# Altium project Merge-Octo-Electrode.PrjPcb
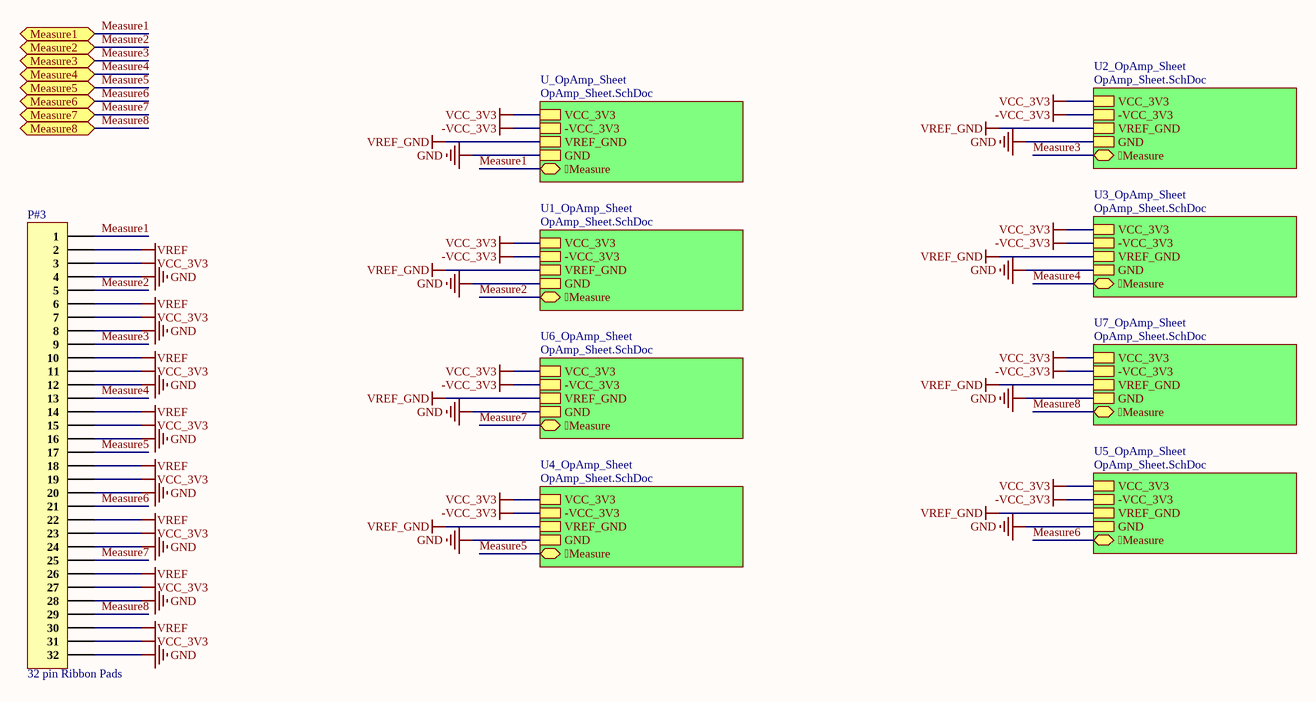
[diagram p0: Main_Sheet.SchDoc]
2 sheets, 265 parts. Net scope: hierarchical (ports join the sheet entries above them; power ports are global).
Board file: Octo-Electrode.PcbDoc
Sheets:
  Main_Sheet.SchDoc
    U_OpAmp_Sheet = OpAmp_Sheet.SchDoc
    U1_OpAmp_Sheet = OpAmp_Sheet.SchDoc
    U2_OpAmp_Sheet = OpAmp_Sheet.SchDoc
    U3_OpAmp_Sheet = OpAmp_Sheet.SchDoc
    U4_OpAmp_Sheet = OpAmp_Sheet.SchDoc
    U5_OpAmp_Sheet = OpAmp_Sheet.SchDoc
    U6_OpAmp_Sheet = OpAmp_Sheet.SchDoc
    U7_OpAmp_Sheet = OpAmp_Sheet.SchDoc

## Sheet Main_Sheet.SchDoc: =Projectname
size A4; SheetNumber: 1; SheetTotal: 2

### Parts
P#3  32 pin Ribbon Pads  [32 pin Ribbon Pads.]

### Sub-sheets
U1_OpAmp_Sheet = OpAmp_Sheet.SchDoc: VCC_3V3, -VCC_3V3, VREF_GND, GND, Measure (bidir)
U2_OpAmp_Sheet = OpAmp_Sheet.SchDoc: VCC_3V3, -VCC_3V3, VREF_GND, GND, Measure (bidir)
U3_OpAmp_Sheet = OpAmp_Sheet.SchDoc: VCC_3V3, -VCC_3V3, VREF_GND, GND, Measure (bidir)
U4_OpAmp_Sheet = OpAmp_Sheet.SchDoc: VCC_3V3, -VCC_3V3, VREF_GND, GND, Measure (bidir)
U5_OpAmp_Sheet = OpAmp_Sheet.SchDoc: VCC_3V3, -VCC_3V3, VREF_GND, GND, Measure (bidir)
U6_OpAmp_Sheet = OpAmp_Sheet.SchDoc: VCC_3V3, -VCC_3V3, VREF_GND, GND, Measure (bidir)
U7_OpAmp_Sheet = OpAmp_Sheet.SchDoc: VCC_3V3, -VCC_3V3, VREF_GND, GND, Measure (bidir)
U_OpAmp_Sheet = OpAmp_Sheet.SchDoc: VCC_3V3, -VCC_3V3, VREF_GND, GND, Measure (bidir)

### Ports
Measure1 (bidir), Measure2 (bidir), Measure3 (bidir), Measure4 (bidir), Measure5 (bidir), Measure6 (bidir), Measure7 (bidir), Measure8 (bidir)

### Nets
-VCC_3V3: sheet U_OpAmp_Sheet/-VCC_3V3, sheet U1_OpAmp_Sheet/-VCC_3V3, sheet U2_OpAmp_Sheet/-VCC_3V3, sheet U3_OpAmp_Sheet/-VCC_3V3, sheet U4_OpAmp_Sheet/-VCC_3V3, sheet U5_OpAmp_Sheet/-VCC_3V3, sheet U6_OpAmp_Sheet/-VCC_3V3, sheet U7_OpAmp_Sheet/-VCC_3V3
GND: P#3.4 P#3.8 P#3.12 P#3.16 P#3.20 P#3.24 P#3.28 P#3.32 ; sheet U_OpAmp_Sheet/GND, sheet U1_OpAmp_Sheet/GND, sheet U2_OpAmp_Sheet/GND, sheet U3_OpAmp_Sheet/GND, sheet U4_OpAmp_Sheet/GND, sheet U5_OpAmp_Sheet/GND, sheet U6_OpAmp_Sheet/GND, sheet U7_OpAmp_Sheet/GND
VCC_3V3: P#3.3 P#3.7 P#3.11 P#3.15 P#3.19 P#3.23 P#3.27 P#3.31 ; sheet U_OpAmp_Sheet/VCC_3V3, sheet U1_OpAmp_Sheet/VCC_3V3, sheet U2_OpAmp_Sheet/VCC_3V3, sheet U3_OpAmp_Sheet/VCC_3V3, sheet U4_OpAmp_Sheet/VCC_3V3, sheet U5_OpAmp_Sheet/VCC_3V3, sheet U6_OpAmp_Sheet/VCC_3V3, sheet U7_OpAmp_Sheet/VCC_3V3
VREF: P#3.2 P#3.6 P#3.10 P#3.14 P#3.18 P#3.22 P#3.26 P#3.30
VREF_GND: sheet U_OpAmp_Sheet/VREF_GND, sheet U1_OpAmp_Sheet/VREF_GND, sheet U2_OpAmp_Sheet/VREF_GND, sheet U3_OpAmp_Sheet/VREF_GND, sheet U4_OpAmp_Sheet/VREF_GND, sheet U5_OpAmp_Sheet/VREF_GND, sheet U6_OpAmp_Sheet/VREF_GND, sheet U7_OpAmp_Sheet/VREF_GND
Measure1: P#3.1 ; port Measure1, sheet U_OpAmp_Sheet/Measure  [project net Measure]
Measure2: P#3.5 ; port Measure2, sheet U1_OpAmp_Sheet/Measure  [project net Measure]
Measure3: P#3.9 ; port Measure3, sheet U2_OpAmp_Sheet/Measure  [project net Measure]
Measure4: P#3.13 ; port Measure4, sheet U3_OpAmp_Sheet/Measure  [project net Measure]
Measure5: P#3.17 ; port Measure5, sheet U4_OpAmp_Sheet/Measure  [project net Measure]
Measure6: P#3.21 ; port Measure6, sheet U5_OpAmp_Sheet/Measure  [project net Measure]
Measure7: P#3.25 ; port Measure7, sheet U6_OpAmp_Sheet/Measure  [project net Measure]
Measure8: P#3.29 ; port Measure8, sheet U7_OpAmp_Sheet/Measure  [project net Measure]

### Notes on the sheet
- File:
- Title:
- Date:
- Page
- Num:
- Total:
- Drawn By: Huzaifa Ali

### Library data of the parts
P#3 = 32 pin Ribbon Pads: Ribbon wire Connection Pads

## Sheet OpAmp_Sheet.SchDoc: =Projectname
size A4; DocumentNumber: 1; SheetNumber: 2; SheetTotal: 2
Used 8 times, as channels U_OpAmp_Sheet, U1_OpAmp_Sheet, U2_OpAmp_Sheet, U3_OpAmp_Sheet, U4_OpAmp_Sheet, U5_OpAmp_Sheet, U6_OpAmp_Sheet, U7_OpAmp_Sheet. Parts and nets are listed once, with the designators drawn on the sheet.
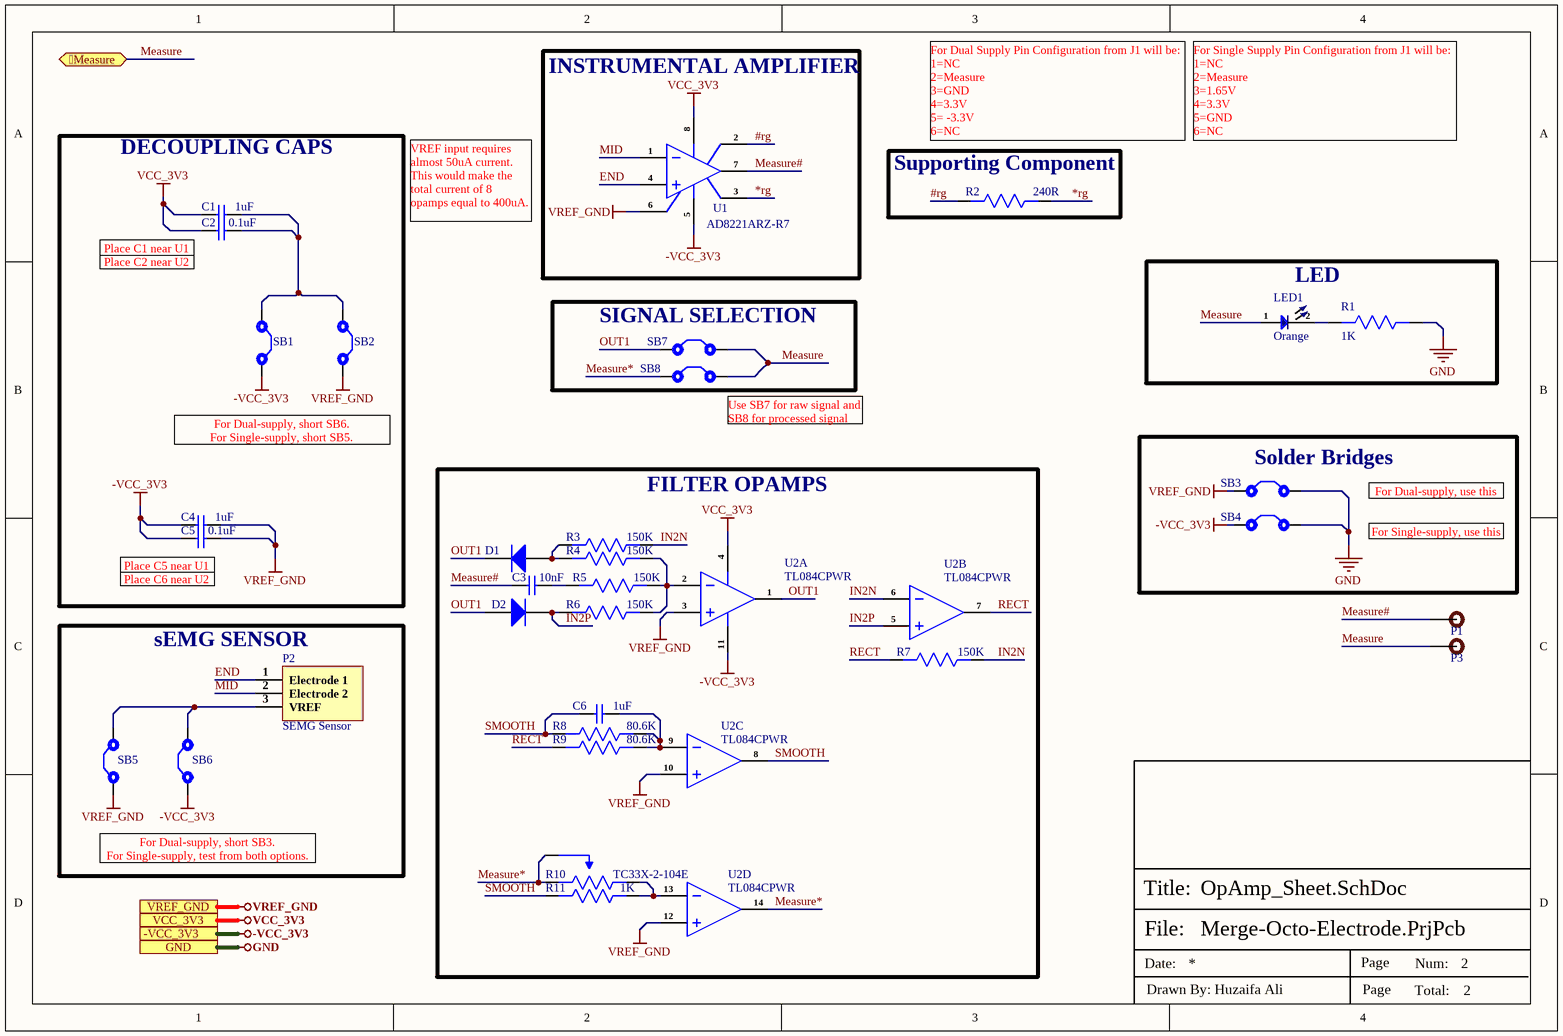
[diagram p1: OpAmp_Sheet.SchDoc]

### Parts
C1  1uF  [Cap-0402]
C2  0.1uF  [Cap-0402]
C3  10nF  [Cap-0402]
C4  1uF  [Cap-0402]
C5  0.1uF  [Cap-0402]
C6  1uF  [Cap-0402]
D1  1N4148WS-7-F  [SOD-323]  (value not drawn)
D2  1N4148WS-7-F  [SOD-323]  (value not drawn)
LED1  Orange  [LED-0603]
P1  Test Point  [Test-point]  (value not drawn)
P2  SEMG Sensor  [sEMG-sensor]
P3  Test Point  [Test-point]  (value not drawn)
R1  1K  [Res-0402]
R2  240R  [Res-0402]
R3  150K  [Res-0402]
R4  150K  [Res-0402]
R5  150K  [Res-0402]
R6  150K  [Res-0402]
R7  150K  [Res-0402]
R8  80.6K  [Res-0402]
R9  80.6K  [Res-0402]
R10  TC33X-2-104E  [TC33X-2-104E_]
R11  1K  [Res-0402]
SB1  Solder Bridge 0402  [Solder Bridge 0402]  (value not drawn)
SB2  Solder Bridge 0402  [Solder Bridge 0402]  (value not drawn)
SB3  Solder Bridge 0402  [Solder Bridge 0402]  (value not drawn)
SB4  Solder Bridge 0402  [Solder Bridge 0402]  (value not drawn)
SB5  Solder Bridge 0402  [Solder Bridge 0402]  (value not drawn)
SB6  Solder Bridge 0402  [Solder Bridge 0402]  (value not drawn)
SB7  Solder Bridge 0402  [Solder Bridge 0402]  (value not drawn)
SB8  Solder Bridge 0402  [Solder Bridge 0402]  (value not drawn)
U1  AD8221ARZ-R7  [SOIC-8]
U2  TL084CPWR  [14-TSSOP]  (parts A,B,C,D of 4)

### Blocks framed on the sheet
INSTRUMENTAL AMPLIFIER: U1
DECOUPLING CAPS: C1 C2 C4 C5 SB1 SB2
Supporting Component: R2
SIGNAL SELECTION: SB7 SB8
LED: LED1 R1
Solder Bridges: SB3 SB4
FILTER OPAMPS: C3 C6 D1 D2 R3-R11 U2
sEMG SENSOR: P2 SB5 SB6

### Ports
Measure (bidir), -VCC_3V3, GND, VCC_3V3, VREF_GND

### Nets
-VCC_3V3: C4.1 C5.1 SB1.2 SB4.1 SB6.2 U1.5(V-) U2.11(VCC-) ; port -VCC_3V3
GND: R1.1 SB3.2 SB4.2 ; port GND
VCC_3V3: C1.1 C2.1 U1.8(V+) U2.4(VCC+) ; port VCC_3V3
VREF_GND: C4.2 C5.2 SB2.2 SB3.1 SB5.2 U1.6(REF) U2.3(IN+) U2.10(3IN+) U2.12(4IN+) ; port VREF_GND
#rg: R2.2 U1.2(RG)
*rg: R2.1 U1.3(RG)
END: P2.1(Electrode_1) U1.4(IN+)
IN2N: R3.1 R7.1 U2.6(2IN-)
IN2P: D2.1(K) R6.2 U2.5(2IN+)
Measure: LED1.1 P3.1 SB7.2 SB8.2 ; port Measure
Measure#: C3.1 P1.1 U1.7(VOUT)
Measure*: R10.1(CCW) R10.2(Wiper) SB8.1 U2.14(4OUT)
MID: P2.2(Electrode_2) U1.1(IN-)
OUT1: D1.1(K) D2.2(A) SB7.1 U2.1(1OUT)
RECT: R7.2 R9.2 U2.7(2OUT)
SMOOTH: C6.1 R8.2 R11.2 U2.8(3OUT)
NetC1_2: C1.2 C2.2 SB1.1 SB2.1
NetC3_2: C3.2 R5.2
NetC6_2: C6.2 R8.1 R9.1 U2.9(3IN-)
NetD1_2: D1.2(A) R3.2 R4.2
NetLED1_2: LED1.2 R1.2
NetP2_3: P2.3(VREF) SB5.1 SB6.1
NetR4_1: R4.1 R5.1 R6.1 U2.2(IN-)
NetR10_3: R10.3(CW) R11.1 U2.13(4IN-)

### Channels
U_OpAmp_Sheet: designators end in _U_OpAmp_Sheet; ports Measure=Measure -VCC_3V3=-VCC_3V3 GND=GND VCC_3V3=VCC_3V3 VREF_GND=VREF_GND
U1_OpAmp_Sheet: designators end in _U1_OpAmp_Sheet; ports Measure=Measure -VCC_3V3=-VCC_3V3 GND=GND VCC_3V3=VCC_3V3 VREF_GND=VREF_GND
U2_OpAmp_Sheet: designators end in _U2_OpAmp_Sheet; ports Measure=Measure -VCC_3V3=-VCC_3V3 GND=GND VCC_3V3=VCC_3V3 VREF_GND=VREF_GND
U3_OpAmp_Sheet: designators end in _U3_OpAmp_Sheet; ports Measure=Measure -VCC_3V3=-VCC_3V3 GND=GND VCC_3V3=VCC_3V3 VREF_GND=VREF_GND
U4_OpAmp_Sheet: designators end in _U4_OpAmp_Sheet; ports Measure=Measure -VCC_3V3=-VCC_3V3 GND=GND VCC_3V3=VCC_3V3 VREF_GND=VREF_GND
U5_OpAmp_Sheet: designators end in _U5_OpAmp_Sheet; ports Measure=Measure -VCC_3V3=-VCC_3V3 GND=GND VCC_3V3=VCC_3V3 VREF_GND=VREF_GND
U6_OpAmp_Sheet: designators end in _U6_OpAmp_Sheet; ports Measure=Measure -VCC_3V3=-VCC_3V3 GND=GND VCC_3V3=VCC_3V3 VREF_GND=VREF_GND
U7_OpAmp_Sheet: designators end in _U7_OpAmp_Sheet; ports Measure=Measure -VCC_3V3=-VCC_3V3 GND=GND VCC_3V3=VCC_3V3 VREF_GND=VREF_GND

### Notes on the sheet
- For Dual Supply Pin Configuration from J1 will be:
  1=NC
  2=Measure
  3=GND
  4=3.3V
  5= -3.3V
  6=NC
- For Single Supply Pin Configuration from J1 will be:
  1=NC
  2=Measure
  3=1.65V
  4=3.3V
  5=GND
  6=NC
- Place C1 near U1
- VREF input requires almost 50uA current. This would make the total current of 8 opamps equal to 400uA.
- Place C2 near U2
- For Dual-supply, short SB6.
  For Single-supply, short SB5.
- (near SB8) Use SB7 for raw signal and SB8 for processed signal
- For Dual-supply, use this
- Place C6 near U2
- Place C5 near U1
- For Single-supply, use this
- For Dual-supply, short SB3.
  For Single-supply, test from both options.
- File:
- Title:
- Date:
- Page
- Num:
- Total:
- Drawn By: Huzaifa Ali

### Library data of the parts
C1 C4 C6 = CC0402KRX5R7BB105: CAP CER 1UF 16V X5R 0402; Manufacturer: Yageo; Tolerance: 10%; Item Type: Capacitor; Supplier 1: Digi-Key; Manufacturer Part Number: CC0402KRX5R7BB105; Stock 1: 1405667; Pricing 1: 1=0.36, 10=0.252, 100=0.1512, 500=0.1134, 1000=0.09576, 2500=0.09072, 5000=0.08568 (USD); Mount: Surface Mount; Case/Package: 0402; Weight: 2.3E-05oz; Case Code (Imperial): 0402; Case Code (Metric): 1005; Min Operating Temperature: -55°C; Max Operating Temperature: 85°C; Capacitance: 1uF; Dielectric: X5R; Packaging: Tape and Reel; Voltage Rating (DC): 16V; Voltage Rating: 16V; Termination: SMD/SMT; Composition: Ceramic; Length: 1mm; Height: 0.5mm; Width: 0.02inch; Thickness: 0.022inch; Depth: 0.5mm; Radiation Hardening: No; Lead Free: Lead Free; Halogen Free: Halogen Free; ComponentLink1URL: http://www.yageo.com/documents/recent/UPY-GPHC_X5R_4V-to-50V_12.pdf?src-supplier=Avnet+Europe; ComponentLink1Description: http://www.yageo.com/documents/recent/UPY-GPHC_X5R_4V-to-50V_12.pdf?src-supplier=Avnet+Europe; Supplier Part Number 1: 311-1691-6-ND; LCSC Part Number: C325464
C2 C5 = GRM155R71H104ME14D: CAP CER 0.1UF 50V X7R 0402; Manufacturer: Murata; Tolerance: 20%; Capacitance: 100nF; Item Type: Capacitor; Supplier 1: Avnet; Manufacturer Part Number: GRM155R71H104ME14D; RoHS: Yes; Category: Ceramic Capacitors; Stock 1: 100000; Pricing 1: 10000=0.00444, 20000=0.00420, 40000=0.00396, 60000=0.00372, 80000=0.00348, 100000=0.00324, 1000000=0.00300 (USD); Mount: Surface Mount; Case/Package: 0402; Min Operating Temperature: -55°C; Max Operating Temperature: 125°C; Packaging: Cut Tape; Voltage Rating: 50V; Length: 0.039inch; Width: 0.02inch; Thickness: 0.022inch; RoHS Compliant: Yes; ComponentLink1URL: http://www.mouser.com/ds/2/281/c02e-2905.pdf?src-supplier=Mouser; ComponentLink1Description: http://www.mouser.com/ds/2/281/c02e-2905.pdf?src-supplier=Mouser; ComponentLink2URL: http://search.murata.co.jp/Ceramy/image/img/A01X/G101/ENG/GRM155R71H104ME14-01.pdf?src-supplier=Digi-Key; ComponentLink2Description: http://search.murata.co.jp/Ceramy/image/img/A01X/G101/ENG/GRM155R71H104ME14-01.pdf?src-supplier=Digi-Key; ComponentLink3URL: http://psearch.en.murata.com/capacitor/product/GRM155R71H104ME14%23.pdf?src-supplier=Avnet; ComponentLink3Description: http://psearch.en.murata.com/capacitor/product/GRM155R71H104ME14%23.pdf?src-supplier=Avnet; Supplier Part Number 1: GRM155R71H104ME14D; LCSC Part Number: C182412
C3 = CC0402KRX7R9BB103: CAP CER 10000PF 50V X7R 0402; Manufacturer: Yageo; Tolerance: 10%; Item Type: Capacitor; Supplier 1: Avnet; Supplier Part Number 1: CC0402KRX7R9BB103; Manufacturer Part Number: CC0402KRX7R9BB103; RoHS: Yes; Category: Ceramic Capacitors; Stock 1: 995000; Pricing 1: 10000=0.00178 (USD); Mount: Surface Mount; Case/Package: 0402; Case Code (Imperial): 0402; Case Code (Metric): 1005; Min Operating Temperature: -55°C; Max Operating Temperature: 125°C; Capacitance: 10nF; Dielectric: X7R; Packaging: Tape and Reel; Voltage Rating: 50V; Voltage Rating (DC): 50V; Package Quantity: 1; Termination: SMD/SMT; Resistor Type: Ceramic; Voltage: 50V; Series: CC; Length: 1mm; Width: 0.02inch; Height: 0.5mm; Thickness: 0.022inch; Depth: 0.5mm; Radiation Hardening: No; RoHS Compliant: Yes; Reach SVHC Compliant: Yes; Lead Free: Lead Free; Halogen Free: Halogen Free; ComponentLink1URL: https://datasheet.ciiva.com/11788/0900766b8079c870-11788375.pdf?src-supplier=RSComponents; ComponentLink1Description: https://datasheet.ciiva.com/11788/0900766b8079c870-11788375.pdf?src-supplier=RSComponents; ComponentLink2URL: https://datasheet.ciiva.com/26862/getdatasheetpartid-138248-26862642.pdf?src-supplier=Verical; ComponentLink2Description: https://datasheet.ciiva.com/26862/getdatasheetpartid-138248-26862642.pdf?src-supplier=Verical; ComponentLink3URL: https://datasheet.ciiva.com/7978/1489800-7978093.pdf?src-supplier=Element14; ComponentLink3Description: https://datasheet.ciiva.com/7978/1489800-7978093.pdf?src-supplier=Element14; ComponentLink4URL: https://datasheet.ciiva.com/28450/1489800-28450377.pdf?src-supplier=Element14; ComponentLink4Description: https://datasheet.ciiva.com/28450/1489800-28450377.pdf?src-supplier=Element14; ComponentLink5URL: https://datasheet.ciiva.com/176/mlccorderingcode-176349.pdf?src-supplier=Digi-Key; ComponentLink5Description: https://datasheet.ciiva.com/176/mlccorderingcode-176349.pdf?src-supplier=Digi-Key; ComponentLink6URL: https://datasheet.ciiva.com/176/mlccorderingcode-176348.pdf?src-supplier=Digi-Key; ComponentLink6Description: https://datasheet.ciiva.com/176/mlccorderingcode-176348.pdf?src-supplier=Digi-Key; ComponentLink7URL: https://datasheet.ciiva.com/176/mlccorderingcode-176350.pdf?src-supplier=Digi-Key; ComponentLink7Description: https://datasheet.ciiva.com/176/mlccorderingcode-176350.pdf?src-supplier=Digi-Key; LCSC Part Number: C60133
D1 D2 = 1N4148WS-7-F: DIODE GEN PURP 75V 150MA SOD323; Manufacturer: Diodes; Forward Current: 300mA; Reverse Recovery Time: 4ns; Element Configuration: Single; Forward Voltage: 1.25V; Max Reverse Current: 1uA; Peak Non-Repetitive Surge Current: 2A; Power Dissipation: 200mW; Polarity: Standard; Capacitance: 2pF; ComponentLink1Description: https://datasheet.ciiva.com/1179/ds30097-1179355.pdf?src-supplier=Element14; ComponentLink1URL: https://datasheet.ciiva.com/1179/ds30097-1179355.pdf?src-supplier=Element14; Manufacturer Part Number: 1N4148WS-7-F; Supplier 1: Mouser; RoHS: Yes; Category: Rectifier Diodes; Pricing 1: 1=0.19000, 10=0.17500, 50=0.17500, 100=0.09600, 500=0.05900, 1000=0.04000, 3000=0.03000, 9000=0.02600, 10000=0.02600, 24000=0.02300, 45000=0.01900 (USD); Mount: Surface Mount; Number of Pins: 2; Weight: 0.000173oz; Contact Plating: Tin,Matte; Min Operating Temperature: -65°C; Max Operating Temperature: 150°C; Max Repetitive Reverse Voltage (Vrrm): 75V; Max Forward Surge Current (Ifsm): 2A; Max Surge Current: 2A; Packaging: Tape and Reel; Recovery Time: 4ns; Package Quantity: 3000; Average Rectified Current: 150mA; Voltage Rating (DC): 75V; Power Rating: 200mW; Current Rating: 150mA; Output Current: 150mA; Voltage: 75V; Max Reverse Voltage (DC): 75V; Series: -; Reverse Recovery Time-Max: 4ns; Length: 1.8mm; Width: 1.4mm; Height: 1mm; Radiation Hardening: No; REACH SVHC: No SVHC; Lead Free: Lead Free; RoHS Compliant: Yes; ComponentLink2URL: https://datasheet.ciiva.com/8300/ds30097-8300396.pdf?src-supplier=Avnet; ComponentLink2Description: https://datasheet.ciiva.com/8300/ds30097-8300396.pdf?src-supplier=Avnet; ComponentLink3URL: https://datasheet.ciiva.com/16199/ds30097-16199061.pdf?src-supplier=Future+Electronics; ComponentLink3Description: https://datasheet.ciiva.com/16199/ds30097-16199061.pdf?src-supplier=Future+Electronics; ComponentLink4URL: https://datasheet.ciiva.com/911/ds30097-911742.pdf?src-supplier=Digi-Key; ComponentLink4Description: https://datasheet.ciiva.com/911/ds30097-911742.pdf?src-supplier=Digi-Key; ComponentLink5URL: https://datasheet.ciiva.com/911/ds30097-911743.pdf?src-supplier=Digi-Key; ComponentLink5Description: https://datasheet.ciiva.com/911/ds30097-911743.pdf?src-supplier=Digi-Key; ComponentLink6URL: https://datasheet.ciiva.com/911/ds30097-911741.pdf?src-supplier=Digi-Key; ComponentLink6Description: https://datasheet.ciiva.com/911/ds30097-911741.pdf?src-supplier=Digi-Key; Supplier Part Number 1: 621-1N4148WS-F; LCSC Part Number: C60580; Item Type: Diode
LED1 = 19-217/S2C-AQ1R1B/3T: 0603(H=0.4mm) λD=600.5~612.5nm VR=5V VF=1.7V~2.2V IF=25mA PD=60mW; Manufacturer: Everlight; Item Type: LED; Supplier 1: Digi-Key; Manufacturer Part Number: 19-217/S2C-AQ1R1B/3T; RoHS: No; Category: LEDs; Supplier Part Number 1: 1080-19-217/S2C-AQ1R1B/3TTR-ND; LCSC Part Number: C146215; ComponentLink1Description: LCSC; ComponentLink1URL: https://www.lcsc.com/product-detail/Light-Emitting-Diodes-LED_Everlight-Elec-19-217-S2C-AQ1R1B-3T_C146215.html
P1 P3 = TEST POINT: Test Point ON; Item Type: TEST POINT
P2 = SEMG Sensor: Sensor Connecting Pads
R1 R11 = RC0402JR-071KL: RES 1K OHM 5% 1/16W 0402; Manufacturer: Yageo; Resistance: 1kR; Power Rating: 62.5mW; Voltage Rating: 50V; Temperature Coefficient: 100ppm/°C; Max Power Dissipation: 63mW; Item Type: Resistor; Supplier 1: Digi-Key; Manufacturer Part Number: RC0402JR-071KL; RoHS: Yes; Category: Chip SMD Resistors; Stock 1: 452315; Pricing 1: 1=0.10000, 10=0.01300, 100=0.00540, 1000=0.00244, 2500=0.00212, 5000=0.00175 (USD); Case/Package: 0402; Case Code (Imperial): 0402; Case Code (Metric): 1005; Size Code: 0402; Min Operating Temperature: -55°C; Max Operating Temperature: 155°C; Tolerance: 5%; Packaging: Tape and Reel; Package Quantity: 1; Termination: SMD/SMT; Resistor Type: Thick Film; Number of Terminations: 2; Features: Moisture Resistant; Series: RC; Resistance Tolerance: 5%; Construction: Rectangular; Length: 0.039inch; Width: 0.02inch; Height: 0.016inch; Depth: 0.5mm; REACH SVHC: No SVHC; Military Standard: Not; Lead Free: Lead Free; RoHS Compliant: Yes; ComponentLink1URL: https://datasheet.ciiva.com/7983/1018594-7983558.pdf?src-supplier=Element14; ComponentLink1Description: https://datasheet.ciiva.com/7983/1018594-7983558.pdf?src-supplier=Element14; ComponentLink2URL: https://datasheet.ciiva.com/2452/pyu-r-int-thick-7-2452756.pdf?src-supplier=Digi-Key; ComponentLink2Description: https://datasheet.ciiva.com/2452/pyu-r-int-thick-7-2452756.pdf?src-supplier=Digi-Key; ComponentLink3URL: https://datasheet.ciiva.com/2452/pyu-r-int-thick-7-2452757.pdf?src-supplier=Digi-Key; ComponentLink3Description: https://datasheet.ciiva.com/2452/pyu-r-int-thick-7-2452757.pdf?src-supplier=Digi-Key; ComponentLink4URL: https://datasheet.ciiva.com/2452/pyu-r-int-thick-7-2452755.pdf?src-supplier=Digi-Key; ComponentLink4Description: https://datasheet.ciiva.com/2452/pyu-r-int-thick-7-2452755.pdf?src-supplier=Digi-Key; ComponentLink5URL: https://datasheet.ciiva.com/7850/1018594-7850170.pdf?src-supplier=Element14; ComponentLink5Description: https://datasheet.ciiva.com/7850/1018594-7850170.pdf?src-supplier=Element14; ComponentLink6URL: https://datasheet.ciiva.com/7850/1018594-7850171.pdf?src-supplier=Element14; ComponentLink6Description: https://datasheet.ciiva.com/7850/1018594-7850171.pdf?src-supplier=Element14; ComponentLink7URL: https://datasheet.ciiva.com/17081/pyu-rc0402-51-rohs-l-6-r-17081438.pdf?src-supplier=Future+Electronics; ComponentLink7Description: https://datasheet.ciiva.com/17081/pyu-rc0402-51-rohs-l-6-r-17081438.pdf?src-supplier=Future+Electronics; Supplier Part Number 1: 311-1.0KJRCT-ND; LCSC Part Number: C105637
R2 = RC0402FR-07240RL: RES 240 OHM 1% 1/16W 0402; Manufacturer: Yageo; Power Rating: 63mW; Temperature Coefficient: 100ppm/°C; Voltage Rating (DC): 50V; Supplier 1: Mouser; Manufacturer Part Number: RC0402FR-07240RL; RoHS: Yes; Category: Chip SMD Resistors; Stock 1: 1903202; Pricing 1: 1=0.10000, 10=0.01200, 50=0.01200, 100=0.00500, 1000=0.00300, 10000=0.00100 (USD); Case/Package: 0402; Case Code (Metric): 1005; Case Code (Imperial): 0402; Size Code: 0402; Min Operating Temperature: -55°C; Max Operating Temperature: 155°C; Resistance: 240R; Tolerance: 1%; Packaging: Tape and Reel; Resistor Type: Thick Film; Voltage Rating: 50V; Package Quantity: 1; Number of Terminations: 2; Termination: SMD/SMT; Max Power Dissipation: 63mW; Features: Moisture Resistant; Series: RC; Construction: Rectangular; Resistance Tolerance: 1%; Length: 1mm; Width: 0.02inch; Height: 0.016inch; Depth: 0.5mm; REACH SVHC: Unknown; Lead Free: Lead Free; RoHS Compliant: Yes; Military Standard: Not; ComponentLink1URL: https://datasheet.ciiva.com/7849/1018594-7849915.pdf?src-supplier=Element14; ComponentLink1Description: https://datasheet.ciiva.com/7849/1018594-7849915.pdf?src-supplier=Element14; ComponentLink2URL: https://datasheet.ciiva.com/7849/1018594-7849916.pdf?src-supplier=Element14; ComponentLink2Description: https://datasheet.ciiva.com/7849/1018594-7849916.pdf?src-supplier=Element14; ComponentLink3URL: https://datasheet.ciiva.com/2519/pyu-r-int-thick-7-2519157.pdf?src-supplier=Digi-Key; ComponentLink3Description: https://datasheet.ciiva.com/2519/pyu-r-int-thick-7-2519157.pdf?src-supplier=Digi-Key; ComponentLink4URL: https://datasheet.ciiva.com/2519/pyu-r-int-thick-7-2519158.pdf?src-supplier=Digi-Key; ComponentLink4Description: https://datasheet.ciiva.com/2519/pyu-r-int-thick-7-2519158.pdf?src-supplier=Digi-Key; ComponentLink5URL: https://datasheet.ciiva.com/2519/pyu-r-int-thick-7-2519156.pdf?src-supplier=Digi-Key; ComponentLink5Description: https://datasheet.ciiva.com/2519/pyu-r-int-thick-7-2519156.pdf?src-supplier=Digi-Key; ComponentLink6URL: https://datasheet.ciiva.com/12669/pyu-rc0402-51-rohs-l-6-r-12669689.pdf?src-supplier=Mouser; ComponentLink6Description: https://datasheet.ciiva.com/12669/pyu-rc0402-51-rohs-l-6-r-12669689.pdf?src-supplier=Mouser; ComponentLink7URL: https://datasheet.ciiva.com/17419/pyu-rc0402-51-rohs-l-6-r-17419482.pdf?src-supplier=Future+Electronics; ComponentLink7Description: https://datasheet.ciiva.com/17419/pyu-rc0402-51-rohs-l-6-r-17419482.pdf?src-supplier=Future+Electronics; Supplier Part Number 1: 603-RC0402FR-07240RL
R3-R7 = RC0402JR-07150KL: RES SMD 0402 150kOhm 5% Paper T/R; Manufacturer: Yageo; Resistance: 150kR; Power Rating: 63mW; Voltage Rating: 50V; Temperature Coefficient: 100ppm/°C; Item Type: Resistor; Supplier 1: Arrow Electronics; Manufacturer Part Number: RC0402JR-07150KL; RoHS: Yes; Category: Chip SMD Resistors; Stock 1: 170000; Pricing 1: 10000=0.00100 (USD); Case/Package: 0402; Case Code (Metric): 1005; Case Code (Imperial): 0402; Weight: 2.3E-05oz; Size Code: 0402; Min Operating Temperature: -55°C; Max Operating Temperature: 155°C; Package Quantity: 1; Tolerance: 5%; Packaging: Tape and Reel; Resistor Type: Thick Film; Number of Terminations: 2; Termination: SMD/SMT; Max Power Dissipation: 63mW; Features: Moisture Resistant; Series: RC; Construction: Rectangular; Resistance Tolerance: 5%; Length: 1mm; Width: 0.02inch; Height: 0.016inch; Depth: 0.5mm; REACH SVHC: No SVHC; Military Standard: Not; Lead Free: Lead Free; RoHS Compliant: Yes; ComponentLink1URL: https://datasheet.ciiva.com/7983/1018594-7983551.pdf?src-supplier=Element14; ComponentLink1Description: https://datasheet.ciiva.com/7983/1018594-7983551.pdf?src-supplier=Element14; ComponentLink2URL: https://datasheet.ciiva.com/2518/pyu-r-int-thick-7-2518929.pdf?src-supplier=Digi-Key; ComponentLink2Description: https://datasheet.ciiva.com/2518/pyu-r-int-thick-7-2518929.pdf?src-supplier=Digi-Key; ComponentLink3URL: https://datasheet.ciiva.com/2518/pyu-r-int-thick-7-2518930.pdf?src-supplier=Digi-Key; ComponentLink3Description: https://datasheet.ciiva.com/2518/pyu-r-int-thick-7-2518930.pdf?src-supplier=Digi-Key; ComponentLink4URL: https://datasheet.ciiva.com/2518/pyu-r-int-thick-7-2518928.pdf?src-supplier=Digi-Key; ComponentLink4Description: https://datasheet.ciiva.com/2518/pyu-r-int-thick-7-2518928.pdf?src-supplier=Digi-Key; ComponentLink5URL: https://datasheet.ciiva.com/7850/1018594-7850149.pdf?src-supplier=Element14; ComponentLink5Description: https://datasheet.ciiva.com/7850/1018594-7850149.pdf?src-supplier=Element14; ComponentLink6URL: https://datasheet.ciiva.com/17072/pyu-rc0402-51-rohs-l-6-r-17072379.pdf?src-supplier=Future+Electronics; ComponentLink6Description: https://datasheet.ciiva.com/17072/pyu-rc0402-51-rohs-l-6-r-17072379.pdf?src-supplier=Future+Electronics; ComponentLink7URL: https://datasheet.ciiva.com/15189/getdatasheetpartid-251830-15189543.pdf?src-supplier=Verical; ComponentLink7Description: https://datasheet.ciiva.com/15189/getdatasheetpartid-251830-15189543.pdf?src-supplier=Verical; Supplier Part Number 1: RC0402JR-07150KL; LCSC Part Number: C137919
R8 R9 = RC-02W8062FT: 1/16W 50V ±1% ±200ppm/℃ -55℃~+155℃ 80.6kΩ 0402 Chip Resistor - Surface Mount ROHS; Manufacturer: FH; Manufacture Part Number: RC-02W8062FT; Footprint: 0402; Value: 80.6K; ComponentLink1Description: LCSC; ComponentLink1URL: https://www.lcsc.com/product-detail/Chip-Resistor-Surface-Mount_FH-Guangdong-Fenghua-Advanced-Tech-RC-02W8062FT_C304637.html; LCSC Part Number: C304637; Item Type: Resistor
R10 = TC33X-2-104E: TRIMMER 100K OHM 0.1W J LEAD TOP; Manufacturer: Bourns; Resistance: 100kR; Tolerance: 25%; Power Rating: 100mW; Number of Turns: 1; Temperature Coefficient: 250ppm/°C; Voltage Rating (DC): 50V; Supplier 1: Arrow Electronics; Manufacturer Part Number: TC33X-2-104E; RoHS: Yes; Category: Variable Resistors and Potentiometers; Stock 1: 12500; Pricing 1: 2500=0.15500, 5000=0.13130 (USD); Mount: Surface Mount; Color: Silver; Weight: 29.4mg; Min Operating Temperature: -40°C; Max Operating Temperature: 100°C; Packaging: Tape and Reel; Package Quantity: 2500; Resistor Type: Carbon,Cermet; Termination: Foot Print; Max Power Dissipation: 100mW; Series: TC33; Resistance Tolerance: 25%; Length: 3mm; Width: 0.118inch; Height: 0.047inch; Depth: 3.8mm; Radiation Hardening: No; REACH SVHC: No SVHC; Military Standard: Not; RoHS Compliant: Yes; ComponentLink1URL: https://datasheet.ciiva.com/11832/0900766b802749b3-11832506.pdf?src-supplier=RSComponents; ComponentLink1Description: https://datasheet.ciiva.com/11832/0900766b802749b3-11832506.pdf?src-supplier=RSComponents; ComponentLink2URL: https://datasheet.ciiva.com/8700/tc33-8700395.pdf?src-supplier=Avnet; ComponentLink2Description: https://datasheet.ciiva.com/8700/tc33-8700395.pdf?src-supplier=Avnet; ComponentLink3URL: https://datasheet.ciiva.com/2155/tc33-2155965.pdf?src-supplier=Digi-Key; ComponentLink3Description: https://datasheet.ciiva.com/2155/tc33-2155965.pdf?src-supplier=Digi-Key; ComponentLink4URL: https://datasheet.ciiva.com/7953/1818686-7953181.pdf?src-supplier=Element14; ComponentLink4Description: https://datasheet.ciiva.com/7953/1818686-7953181.pdf?src-supplier=Element14; ComponentLink5URL: https://datasheet.ciiva.com/16716/70155234-16716301.pdf?src-supplier=Allied+Electronics; ComponentLink5Description: https://datasheet.ciiva.com/16716/70155234-16716301.pdf?src-supplier=Allied+Electronics; ComponentLink6URL: https://datasheet.ciiva.com/2155/tc33-2155966.pdf?src-supplier=Digi-Key; ComponentLink6Description: https://datasheet.ciiva.com/2155/tc33-2155966.pdf?src-supplier=Digi-Key; ComponentLink7URL: https://datasheet.ciiva.com/7953/1818686-7953182.pdf?src-supplier=Element14; ComponentLink7Description: https://datasheet.ciiva.com/7953/1818686-7953182.pdf?src-supplier=Element14; ComponentLink8URL: https://datasheet.ciiva.com/2155/tc33-2155967.pdf?src-supplier=Digi-Key; ComponentLink8Description: https://datasheet.ciiva.com/2155/tc33-2155967.pdf?src-supplier=Digi-Key; Supplier Part Number 1: TC33X-2-104E; LCSC Part Number: C719186; Item Type: Trimmer
SB1-SB8 = Solder Bridge 0402: Solder Bridge ON
U1 = AD8221ARZ-R7: IC OPAMP INSTR 825KHZ 8SOIC; Manufacturer: Analog Devices; Number of Channels: 1; Common Mode Rejection Ratio: 80dB; Min Dual Supply Voltage: 2.3V; Max Dual Supply Voltage: 18V; Slew Rate: 2.5V/µs; Nominal Supply Current: 1mA; Max Power Dissipation: 200mW; Bandwidth: 562kHz; Input Bias Current: 1.5nA; Input Offset Voltage (Vos): 60uV; Output Current per Channel: 18mA; Power Supply Rejection Ratio (PSRR): 130dB; Voltage Gain: 60dB; Input Resistance: 100GR; Quiescent Current: 900uA; Operating Supply Voltage: 36V; Supplier 1: Mouser; Manufacturer Part Number: AD8221ARZ-R7; RoHS: Yes; Category: Amplifiers - Op Amps, Buffer, Instrumentation; Pricing 1: 1=7.37000, 10=6.66000, 25=6.35000, 50=6.35000, 100=5.51000, 250=5.27000, 500=4.80000, 1000=4.37000, 10000=4.37000 (USD); Case/Package: SOIC; Number of Pins: 8; Contact Plating: Tin,Matte; Min Operating Temperature: -40°C; Max Operating Temperature: 85°C; -3db Bandwidth: 825kHz; Package Quantity: 1000; Packaging: Tape and Reel; Number of Circuits: 1; Operating Supply Current: 1mA; Number of Elements: 1; Power Dissipation: 200mW; Series: -; Supply Current: 1mA; Radiation Hardening: No; Lead Free: Contains Lead; RoHS Compliant: Yes; ComponentLink1URL: https://datasheet.ciiva.com/15128/getdatasheetpartid-313520-15128733.pdf?src-supplier=Verical; ComponentLink1Description: https://datasheet.ciiva.com/15128/getdatasheetpartid-313520-15128733.pdf?src-supplier=Verical; ComponentLink2URL: https://datasheet.ciiva.com/2975/ad8221-2975658.pdf?src-supplier=Avnet; ComponentLink2Description: https://datasheet.ciiva.com/2975/ad8221-2975658.pdf?src-supplier=Avnet; ComponentLink3URL: https://datasheet.ciiva.com/2975/ad8221-2975980.pdf?src-supplier=Avnet; ComponentLink3Description: https://datasheet.ciiva.com/2975/ad8221-2975980.pdf?src-supplier=Avnet; ComponentLink4URL: https://datasheet.ciiva.com/6628/ad8221-6628618.pdf?src-supplier=Digi-Key; ComponentLink4Description: https://datasheet.ciiva.com/6628/ad8221-6628618.pdf?src-supplier=Digi-Key; ComponentLink5URL: https://datasheet.ciiva.com/6628/ad8221-6628619.pdf?src-supplier=Digi-Key; ComponentLink5Description: https://datasheet.ciiva.com/6628/ad8221-6628619.pdf?src-supplier=Digi-Key; ComponentLink6URL: https://datasheet.ciiva.com/6628/ad8221-6628617.pdf?src-supplier=Digi-Key; ComponentLink6Description: https://datasheet.ciiva.com/6628/ad8221-6628617.pdf?src-supplier=Digi-Key; ComponentLink7URL: https://datasheet.ciiva.com/48709/001249009-da-01-en-ic-amp-inst-prec-ad8221arz-r7-soic-8-adi-48709526.pdf?src-supplier=Conrad; ComponentLink7Description: https://datasheet.ciiva.com/48709/001249009-da-01-en-ic-amp-inst-prec-ad8221arz-r7-soic-8-adi-48709526.pdf?src-supplier=Conrad; Supplier Part Number 1: 584-AD8221ARZ-R7; LCSC Part Number: C13342; Item Type: IC
U2 = TL084CPWR: IC OPAMP JFET 4 CIRCUIT 14TSSOP; Manufacturer: Texas Instruments; Nominal Supply Current: 11.2mA; Number of Channels: 4; Voltage Gain: 106.02dB; Max Dual Supply Voltage: 18V; Min Dual Supply Voltage: 3.5V; Unity Gain Bandwidth Product: 3MHz; Common Mode Rejection Ratio: 70dB; Slew Rate: 13V/µs; Max I/O Voltage: 15mV; Input Bias Current: 400pA; Operating Supply Current: 1.4mA; Min Supply Voltage: 7V; Quiescent Current: 2.8A; Max Power Dissipation: 680mW; Supplier 1: Mouser; Manufacturer Part Number: TL084CPWR; RoHS: Yes; Category: Amplifiers - Op Amps, Buffer, Instrumentation; Stock 1: 3; Pricing 1: 1=0.64000, 10=0.54500, 50=0.54500, 100=0.37800, 500=0.32000, 1000=0.24700, 2000=0.22500, 10000=0.22500 (USD); Case/Package: TSSOP; Number of Pins: 14; Contact Plating: Gold; Min Operating Temperature: -40°C; Max Operating Temperature: 125°C; Packaging: Tape and Reel; Package Quantity: 1; Bandwidth: 3MHz; Nominal Gain Bandwidth Product: 3MHz; Number of Circuits: 4; Gain Bandwidth Product: 3MHz; Input Offset Voltage (Vos): 15mV; Number of Elements: 4; Max Supply Voltage: 18V; Number of Amplifiers: 4; Radiation Hardening: No; Lead Free: Lead Free; RoHS Compliant: Yes; REACH SVHC: No SVHC; ComponentLink1URL: https://datasheet.ciiva.com/34301/1064719-34301936.pdf?src-supplier=Jameco; ComponentLink1Description: https://datasheet.ciiva.com/34301/1064719-34301936.pdf?src-supplier=Jameco; ComponentLink2URL: https://datasheet.ciiva.com/1795/tl081a-1795644.pdf?src-supplier=Digi-Key; ComponentLink2Description: https://datasheet.ciiva.com/1795/tl081a-1795644.pdf?src-supplier=Digi-Key; ComponentLink3URL: https://datasheet.ciiva.com/1795/tl081a-1795643.pdf?src-supplier=Digi-Key; ComponentLink3Description: https://datasheet.ciiva.com/1795/tl081a-1795643.pdf?src-supplier=Digi-Key; ComponentLink4URL: https://datasheet.ciiva.com/1795/tl081a-1795645.pdf?src-supplier=Digi-Key; ComponentLink4Description: https://datasheet.ciiva.com/1795/tl081a-1795645.pdf?src-supplier=Digi-Key; ComponentLink5URL: https://datasheet.ciiva.com/14459/tl082-14459749.pdf?src-supplier=Avnet; ComponentLink5Description: https://datasheet.ciiva.com/14459/tl082-14459749.pdf?src-supplier=Avnet; ComponentLink6URL: https://datasheet.ciiva.com/48707/001072249-da-01-en-ic-opamp-jfet-3mh-tl084cpwr-tssop-14-tid-48707867.pdf?src-supplier=Conrad; ComponentLink6Description: https://datasheet.ciiva.com/48707/001072249-da-01-en-ic-opamp-jfet-3mh-tl084cpwr-tssop-14-tid-48707867.pdf?src-supplier=Conrad; Supplier Part Number 1: 595-TL084CPWR

## Nets that join several sheets
-VCC_3V3: U_OpAmp_Sheet (7 pins), U1_OpAmp_Sheet (7 pins), U2_OpAmp_Sheet (7 pins), U3_OpAmp_Sheet (7 pins), U4_OpAmp_Sheet (7 pins), U5_OpAmp_Sheet (7 pins), U6_OpAmp_Sheet (7 pins), U7_OpAmp_Sheet (7 pins)
GND: Main_Sheet (8 pins), U_OpAmp_Sheet (R1_U_OpAmp_Sheet.1 SB3_U_OpAmp_Sheet.2 SB4_U_OpAmp_Sheet.2), U1_OpAmp_Sheet (R1_U1_OpAmp_Sheet.1 SB3_U1_OpAmp_Sheet.2 SB4_U1_OpAmp_Sheet.2), U2_OpAmp_Sheet (R1_U2_OpAmp_Sheet.1 SB3_U2_OpAmp_Sheet.2 SB4_U2_OpAmp_Sheet.2), U3_OpAmp_Sheet (R1_U3_OpAmp_Sheet.1 SB3_U3_OpAmp_Sheet.2 SB4_U3_OpAmp_Sheet.2), U4_OpAmp_Sheet (R1_U4_OpAmp_Sheet.1 SB3_U4_OpAmp_Sheet.2 SB4_U4_OpAmp_Sheet.2), U5_OpAmp_Sheet (R1_U5_OpAmp_Sheet.1 SB3_U5_OpAmp_Sheet.2 SB4_U5_OpAmp_Sheet.2), U6_OpAmp_Sheet (R1_U6_OpAmp_Sheet.1 SB3_U6_OpAmp_Sheet.2 SB4_U6_OpAmp_Sheet.2), U7_OpAmp_Sheet (R1_U7_OpAmp_Sheet.1 SB3_U7_OpAmp_Sheet.2 SB4_U7_OpAmp_Sheet.2)
VCC_3V3: Main_Sheet (8 pins), U_OpAmp_Sheet (C1_U_OpAmp_Sheet.1 C2_U_OpAmp_Sheet.1 U1_U_OpAmp_Sheet.8 U2_U_OpAmp_Sheet.4), U1_OpAmp_Sheet (C1_U1_OpAmp_Sheet.1 C2_U1_OpAmp_Sheet.1 U1_U1_OpAmp_Sheet.8 U2_U1_OpAmp_Sheet.4), U2_OpAmp_Sheet (C1_U2_OpAmp_Sheet.1 C2_U2_OpAmp_Sheet.1 U1_U2_OpAmp_Sheet.8 U2_U2_OpAmp_Sheet.4), U3_OpAmp_Sheet (C1_U3_OpAmp_Sheet.1 C2_U3_OpAmp_Sheet.1 U1_U3_OpAmp_Sheet.8 U2_U3_OpAmp_Sheet.4), U4_OpAmp_Sheet (C1_U4_OpAmp_Sheet.1 C2_U4_OpAmp_Sheet.1 U1_U4_OpAmp_Sheet.8 U2_U4_OpAmp_Sheet.4), U5_OpAmp_Sheet (C1_U5_OpAmp_Sheet.1 C2_U5_OpAmp_Sheet.1 U1_U5_OpAmp_Sheet.8 U2_U5_OpAmp_Sheet.4), U6_OpAmp_Sheet (C1_U6_OpAmp_Sheet.1 C2_U6_OpAmp_Sheet.1 U1_U6_OpAmp_Sheet.8 U2_U6_OpAmp_Sheet.4), U7_OpAmp_Sheet (C1_U7_OpAmp_Sheet.1 C2_U7_OpAmp_Sheet.1 U1_U7_OpAmp_Sheet.8 U2_U7_OpAmp_Sheet.4)
VREF_GND: U_OpAmp_Sheet (9 pins), U1_OpAmp_Sheet (9 pins), U2_OpAmp_Sheet (9 pins), U3_OpAmp_Sheet (9 pins), U4_OpAmp_Sheet (9 pins), U5_OpAmp_Sheet (9 pins), U6_OpAmp_Sheet (9 pins), U7_OpAmp_Sheet (9 pins)
Measure: Main_Sheet (P#3.1), U_OpAmp_Sheet (LED1_U_OpAmp_Sheet.1 P3_U_OpAmp_Sheet.1 SB7_U_OpAmp_Sheet.2 SB8_U_OpAmp_Sheet.2)
Measure: Main_Sheet (P#3.5), U1_OpAmp_Sheet (LED1_U1_OpAmp_Sheet.1 P3_U1_OpAmp_Sheet.1 SB7_U1_OpAmp_Sheet.2 SB8_U1_OpAmp_Sheet.2)
Measure: Main_Sheet (P#3.9), U2_OpAmp_Sheet (LED1_U2_OpAmp_Sheet.1 P3_U2_OpAmp_Sheet.1 SB7_U2_OpAmp_Sheet.2 SB8_U2_OpAmp_Sheet.2)
Measure: Main_Sheet (P#3.13), U3_OpAmp_Sheet (LED1_U3_OpAmp_Sheet.1 P3_U3_OpAmp_Sheet.1 SB7_U3_OpAmp_Sheet.2 SB8_U3_OpAmp_Sheet.2)
Measure: Main_Sheet (P#3.17), U4_OpAmp_Sheet (LED1_U4_OpAmp_Sheet.1 P3_U4_OpAmp_Sheet.1 SB7_U4_OpAmp_Sheet.2 SB8_U4_OpAmp_Sheet.2)
Measure: Main_Sheet (P#3.21), U5_OpAmp_Sheet (LED1_U5_OpAmp_Sheet.1 P3_U5_OpAmp_Sheet.1 SB7_U5_OpAmp_Sheet.2 SB8_U5_OpAmp_Sheet.2)
Measure: Main_Sheet (P#3.25), U6_OpAmp_Sheet (LED1_U6_OpAmp_Sheet.1 P3_U6_OpAmp_Sheet.1 SB7_U6_OpAmp_Sheet.2 SB8_U6_OpAmp_Sheet.2)
Measure: Main_Sheet (P#3.29), U7_OpAmp_Sheet (LED1_U7_OpAmp_Sheet.1 P3_U7_OpAmp_Sheet.1 SB7_U7_OpAmp_Sheet.2 SB8_U7_OpAmp_Sheet.2)